# Altium schematic sheet LNA.SchDoc
size A; SheetNumber: 4; SheetTotal: 9
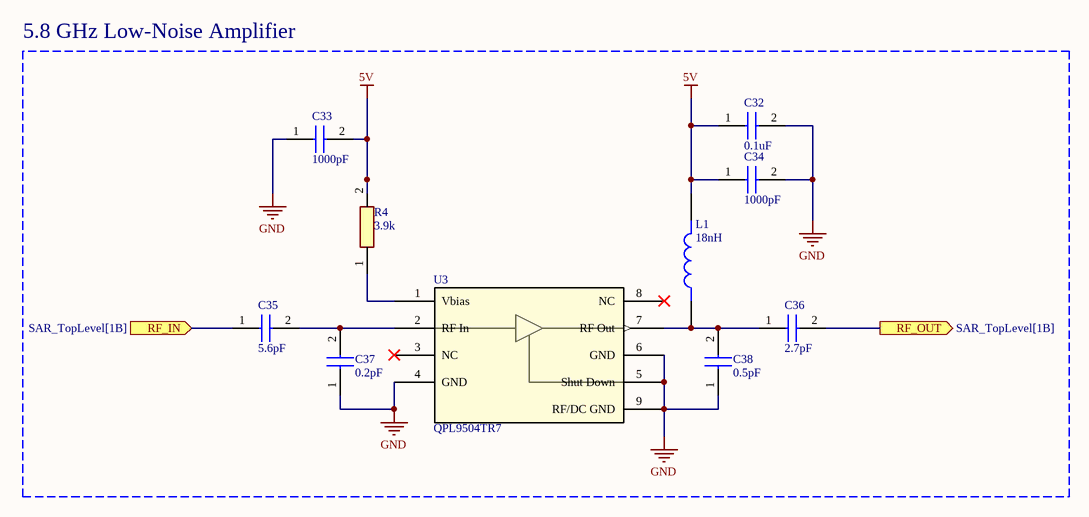
[diagram p0: LNA.SchDoc]

## Parts
C32  0.1uF  [CAPC1005X70N]
C33  1000pF  [CAPC1005X70N]
C34  1000pF  [CAPC1005X70N]
C35  5.6pF  [CAPC1005X55N]
C36  2.7pF  [CAPC1005X55N]
C37  0.2pF  [CAPC1005X55N]
C38  0.5pF  [CAPC1005X55N]
L1  18nH  [IND_0603CS-18NXJRW]
R4  3.9k  [RESC1005X40N]
U3  QPL9504TR7  [SON_504TR7_QOR]

## Blocks framed on the sheet
5.8 GHz Low-Noise Amplifier: C32-C38 L1 R4 U3

## Ports
RF_IN (in, see SAR_TopLevel[1B]), RF_OUT (out, see SAR_TopLevel[1B])

## Nets
5V: C32.1 C33.2 C34.1 L1.2 R4.2
GND: C32.2 C33.1 C34.2 C37.1 C38.1 U3.4(GND) U3.5(Shut_Down) U3.6(GND) U3.9(RF/DC_GND)
RF_IN: C35.1 ; port RF_IN
RF_OUT: C36.2 ; port RF_OUT
NetC35_2: C35.2 C37.2 U3.2(RF_In)
NetC36_1: C36.1 C38.2 L1.1 U3.7(RF_Out)
NetR4_1: R4.1 U3.1(Vbias)

Not connected (* = marked no-connect by the designer): U3 3(NC)* 8(NC)*

## Library data of the parts
C32 = 0.1uF 0402 Capacitor: GRM155R61A104KA01D; Manufacturer_Name: Murata Electronics; Datasheet Link: https://search.murata.co.jp/Ceramy/image/img/A01X/G101/ENG/GRM155R61A104KA01-02A.pdf; Height: 0.7mm; Manufacturer_Part_Number: GRM155R61A104KA01D; Mouser Part Number: 81-GRM155R61A104KA01; Mouser Price/Stock: https://www.mouser.co.uk/ProductDetail/Murata-Electronics/GRM155R61A104KA01D?qs=5bAuhL3RhmNZw0v59AqOJA%3D%3D; Arrow Part Number: GRM155R61A104KA01D; Arrow Price/Stock: https://www.arrow.com/en/products/grm155r61a104ka01d/murata-manufacturing?utm_currency=USD&region=nac
C33 C34 = 1000pF 0402 Capacitor: GRM155R71H102KA01D; Manufacturer_Name: Murata Electronics; Datasheet Link: https://search.murata.co.jp/Ceramy/image/img/A01X/G101/ENG/GRM155R71H102KA01-01A.pdf; Height: 0.7mm; Manufacturer_Part_Number: GRM155R71H102KA01D; Mouser Part Number: 81-GRM36X102K50; Mouser Price/Stock: https://www.mouser.co.uk/ProductDetail/Murata-Electronics/GRM155R71H102KA01D?qs=%252B5p24MMGZE%2FUF%252ByMyO6GBQ%3D%3D; Arrow Part Number: GRM155R71H102KA01D; Arrow Price/Stock: https://www.arrow.com/en/products/grm155r71h102ka01d/murata-manufacturing?utm_currency=USD&region=nac
C35 = 5.6pF 0402 Capacitor: GJM1555C1H5R6CB01D; Manufacturer_Name: Murata Electronics; Datasheet Link: https://search.murata.co.jp/Ceramy/image/img/A01X/G101/ENG/GJM1555C1H5R6CB01-01A.pdf; Height: 0.55mm; Manufacturer_Part_Number: GJM1555C1H5R6CB01D; Mouser Part Number: 81-GJM1555C1H5R6CB01; Mouser Price/Stock: https://www.mouser.co.uk/ProductDetail/Murata-Electronics/GJM1555C1H5R6CB01D?qs=8NPnst0KC%2FrMobio5LeaaQ%3D%3D; Arrow Part Number: GJM1555C1H5R6CB01D; Arrow Price/Stock: https://www.arrow.com/en/products/gjm1555c1h5r6cb01d/murata-manufacturing?region=nac
C36 = 2.7pF 0402 Capacitor: GJM1555C1H2R7CB01D; Manufacturer_Name: Murata Electronics; Datasheet Link: https://search.murata.co.jp/Ceramy/image/img/A01X/G101/ENG/GJM1555C1H2R7CB01-01A.pdf; Height: 0.55mm; Manufacturer_Part_Number: GJM1555C1H2R7CB01D; Mouser Part Number: 81-GJM1555C1H2R7CB1D; Mouser Price/Stock: https://www.mouser.com/Search/ProductDetail.aspx?qs=%2fCESi%252brw7l%252bwXyZVZJ18SA%3d%3d; Arrow Part Number: GJM1555C1H2R7CB01D; Arrow Price/Stock: https://www.arrow.com/en/products/gjm1555c1h2r7cb01d/murata-manufacturing
C37 = 0.2pF 0402 Capacitor: GJM1555C1HR20BB01D; Manufacturer_Name: Murata Electronics; Datasheet Link: https://search.murata.co.jp/Ceramy/image/img/A01X/G101/ENG/GJM1555C1HR20BB01-01A.pdf; Height: 0.55mm; Manufacturer_Part_Number: GJM1555C1HR20BB01D
C38 = 0.5pF 0402 Capacitor: GJM1555C1HR50BB01D; Manufacturer_Name: Murata Electronics; Datasheet Link: https://search.murata.co.jp/Ceramy/image/img/A01X/G101/ENG/GJM1555C1HR50BB01-01A.pdf; Height: 0.55mm; Manufacturer_Part_Number: GJM1555C1HR50BB01D; Mouser Part Number: 81-GJM1555C1HR50BB01; Mouser Price/Stock: https://www.mouser.com/Search/Refine.aspx?Keyword=81-GJM1555C1HR50BB01; Arrow Part Number: GJM1555C1HR50BB01D; Arrow Price/Stock: https://www.arrow.com/en/products/gjm1555c1hr50bb01d/murata-manufacturing
L1 = 18nH 0603 Inductor: 0603CS-18NXJRW; Package: None; Price: None; Value: *; MP: 0603CS-18NXJRW; Availability: Unavailable
R4 = 3.9k 0402 Resistor: RC0402FR-073K9L; Manufacturer_Name: Yageo Group; Datasheet Link: http://www.yageo.com/documents/recent/PYu-RC0402_51_RoHS_L_6_r.pdf; Height: 0.4mm; Manufacturer_Part_Number: RC0402FR-073K9L; Mouser Part Number: 603-RC0402FR-073K9L; Mouser Price/Stock: https://www.mouser.co.uk/ProductDetail/Yageo/RC0402FR-073K9L?qs=YUgVZYePFqAZ%2F08ApUOsXg%3D%3D; Arrow Part Number: RC0402FR-073K9L; Arrow Price/Stock: https://www.arrow.com/en/products/rc0402fr-073k9l/yageo
U3 = QPL9504TR7: Description; Manufacturer_Name: Qorvo; Copyright: Copyright (C) 2026 Ultra Librarian. All rights reserved.; Manufacturer_Part_Number: QPL9504TR7; RefDes: RefDes; Type: Type